# Altium schematic sheet Sensor_Sheet_2.SchDoc
size A4; DocumentNumber: 4; SheetNumber: 4; SheetTotal: 11
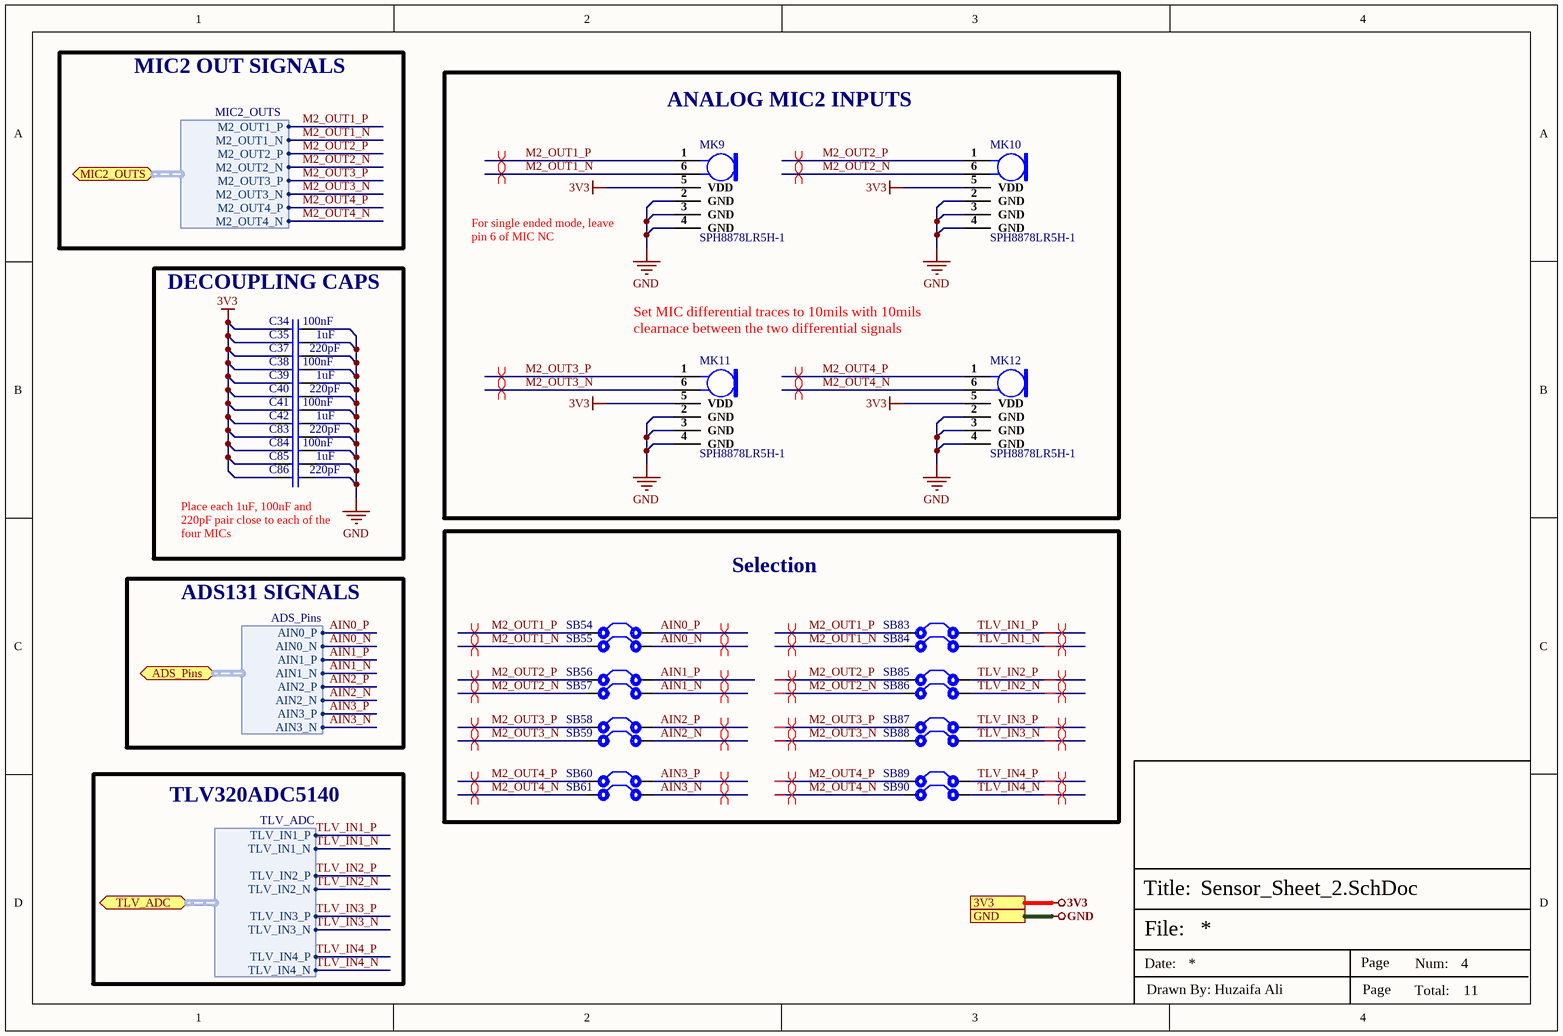
[diagram p0: Sensor_Sheet_2.SchDoc]

## Parts
C34  100nF  [Cap-0603]
C35  1uF  [Cap-0402]
C37  220pF  [Cap 0402]
C38  100nF  [Cap-0603]
C39  1uF  [Cap-0402]
C40  220pF  [Cap 0402]
C41  100nF  [Cap-0603]
C42  1uF  [Cap-0402]
C83  220pF  [Cap 0402]
C84  100nF  [Cap-0603]
C85  1uF  [Cap-0402]
C86  220pF  [Cap 0402]
MK9  SPH8878LR5H-1  [SPH8878LR5H-1]
MK10  SPH8878LR5H-1  [SPH8878LR5H-1]
MK11  SPH8878LR5H-1  [SPH8878LR5H-1]
MK12  SPH8878LR5H-1  [SPH8878LR5H-1]
SB54  Solder Bridge  [Solder Bridge]  (value not drawn)
SB55  Solder Bridge  [Solder Bridge]  (value not drawn)
SB56  Solder Bridge  [Solder Bridge]  (value not drawn)
SB57  Solder Bridge  [Solder Bridge]  (value not drawn)
SB58  Solder Bridge  [Solder Bridge]  (value not drawn)
SB59  Solder Bridge  [Solder Bridge]  (value not drawn)
SB60  Solder Bridge  [Solder Bridge]  (value not drawn)
SB61  Solder Bridge  [Solder Bridge]  (value not drawn)
SB83  Solder Bridge  [Solder Bridge]  (value not drawn)
SB84  Solder Bridge  [Solder Bridge]  (value not drawn)
SB85  Solder Bridge  [Solder Bridge]  (value not drawn)
SB86  Solder Bridge  [Solder Bridge]  (value not drawn)
SB87  Solder Bridge  [Solder Bridge]  (value not drawn)
SB88  Solder Bridge  [Solder Bridge]  (value not drawn)
SB89  Solder Bridge  [Solder Bridge]  (value not drawn)
SB90  Solder Bridge  [Solder Bridge]  (value not drawn)

## Blocks framed on the sheet
ANALOG MIC2 INPUTS: MK9-MK12
DECOUPLING CAPS: C34 C35 C37-C42 C83-C86
Selection: SB54-SB61 SB83-SB90

## Ports
3V3, ADS_Pins (bidir, harness ADS_Pins), GND, MIC2_OUTS (bidir, harness MIC2_OUTS), TLV_ADC (bidir, harness TLV_ADC)

## Harnesses
ADS_Pins: AIN2_P, AIN2_N, AIN3_N, AIN3_P, AIN0_P, AIN0_N, AIN1_N, AIN1_P
TLV_ADC: TLV_IN1_P, TLV_IN1_N, TLV_IN2_P, TLV_IN2_N, TLV_IN3_P, TLV_IN3_N, TLV_IN4_P, TLV_IN4_N
MIC2_OUTS: M2_OUT2_P, M2_OUT1_P, M2_OUT1_N, M2_OUT2_N, M2_OUT4_P, M2_OUT3_P, M2_OUT3_N, M2_OUT4_N

## Nets
3V3: C34.1 C35.1 C37.1 C38.1 C39.1 C40.1 C41.1 C42.1 C83.1 C84.1 C85.1 C86.1 MK9.5(VDD) MK10.5(VDD) MK11.5(VDD) MK12.5(VDD) ; port 3V3
GND: C34.2 C35.2 C37.2 C38.2 C39.2 C40.2 C41.2 C42.2 C83.2 C84.2 C85.2 C86.2 MK9.2(GND) MK9.3(GND) MK9.4(GND) MK10.2(GND) MK10.3(GND) MK10.4(GND) MK11.2(GND) MK11.3(GND) MK11.4(GND) MK12.2(GND) MK12.3(GND) MK12.4(GND) ; port GND
AIN0_N: SB55.2 ; port ADS_Pins.AIN0_N
AIN0_P: SB54.2 ; port ADS_Pins.AIN0_P
AIN1_N: SB57.2 ; port ADS_Pins.AIN1_N
AIN1_P: SB56.2 ; port ADS_Pins.AIN1_P
AIN2_N: SB59.2 ; port ADS_Pins.AIN2_N
AIN2_P: SB58.2 ; port ADS_Pins.AIN2_P
AIN3_N: SB61.2 ; port ADS_Pins.AIN3_N
AIN3_P: SB60.2 ; port ADS_Pins.AIN3_P
M2_OUT1_N: MK9.6(OUT-) SB55.1 SB84.1 ; port MIC2_OUTS.M2_OUT1_N
M2_OUT1_P: MK9.1(OUT+) SB54.1 SB83.1 ; port MIC2_OUTS.M2_OUT1_P
M2_OUT2_N: MK10.6(OUT-) SB57.1 SB86.1 ; port MIC2_OUTS.M2_OUT2_N
M2_OUT2_P: MK10.1(OUT+) SB56.1 SB85.1 ; port MIC2_OUTS.M2_OUT2_P
M2_OUT3_N: MK11.6(OUT-) SB59.1 SB88.1 ; port MIC2_OUTS.M2_OUT3_N
M2_OUT3_P: MK11.1(OUT+) SB58.1 SB87.1 ; port MIC2_OUTS.M2_OUT3_P
M2_OUT4_N: MK12.6(OUT-) SB61.1 SB90.1 ; port MIC2_OUTS.M2_OUT4_N
M2_OUT4_P: MK12.1(OUT+) SB60.1 SB89.1 ; port MIC2_OUTS.M2_OUT4_P
TLV_IN1_N: SB84.2 ; port TLV_ADC.TLV_IN1_N
TLV_IN1_P: SB83.2 ; port TLV_ADC.TLV_IN1_P
TLV_IN2_N: SB86.2 ; port TLV_ADC.TLV_IN2_N
TLV_IN2_P: SB85.2 ; port TLV_ADC.TLV_IN2_P
TLV_IN3_N: SB88.2 ; port TLV_ADC.TLV_IN3_N
TLV_IN3_P: SB87.2 ; port TLV_ADC.TLV_IN3_P
TLV_IN4_N: SB90.2 ; port TLV_ADC.TLV_IN4_N
TLV_IN4_P: SB89.2 ; port TLV_ADC.TLV_IN4_P

## Layout directives
differential pair; net class OUT1; differential pair class OUT1_Lines: M2_OUT1_N, M2_OUT1_P, M2_OUT2_N, M2_OUT2_P, M2_OUT3_N, M2_OUT3_P, M2_OUT4_N, M2_OUT4_P
differential pair; net class AIN0; differential pair class AIN0_Lines: AIN0_N, AIN0_P
differential pair; net class AIN1; differential pair class AIN1_Lines: AIN1_N, AIN1_P
differential pair; net class AIN2; differential pair class AIN2_Lines: AIN2_N, AIN2_P
differential pair; net class AIN3; differential pair class AIN3_Lines: AIN3_N, AIN3_P
differential pair; net class M2_OUT1; differential pair class M2_OUT1_Lines: M2_OUT1_N, M2_OUT1_P
differential pair; net class M2_OUT2; differential pair class M2_OUT2_Lines: M2_OUT2_N, M2_OUT2_P
differential pair; net class M2_OUT3; differential pair class M2_OUT3_Lines: M2_OUT3_N, M2_OUT3_P
differential pair; net class M2_OUT4; differential pair class M2_OUT4_Lines: M2_OUT4_N, M2_OUT4_P
differential pair; net class TLV_IN1; differential pair class TLV_IN1_Lines: TLV_IN1_N, TLV_IN1_P
differential pair; net class TLV_IN2; differential pair class TLV_IN2_Lines: TLV_IN2_N, TLV_IN2_P
differential pair; net class TLV_IN3; differential pair class TLV_IN3_Lines: TLV_IN3_N, TLV_IN3_P
differential pair; net class TLV_IN4; differential pair class TLV_IN4_Lines: TLV_IN4_N, TLV_IN4_P

## Notes on the sheet
- MIC2 OUT SIGNALS
- For single ended mode, leave pin 6 of MIC NC
- (near MK11) Set MIC differential traces to 10mils with 10mils clearnace between the two differential signals
- Place each 1uF, 100nF and 220pF pair close to each of the four MICs
- ADS131 SIGNALS
- TLV320ADC5140
- File:
- Title:
- Date:
- Page
- Num:
- Total:
- Drawn By: Huzaifa Ali

## Library data of the parts
C34 C38 C41 C84 = CC0603KRX5R9BB104: CAP CER 0.1UF 50V X5R 0603; Manufacturer: Yageo; Tolerance: 10%; Item Type: Capacitor; Supplier 1: Digi-Key; Manufacturer Part Number: CC0603KRX5R9BB104; RoHS: Yes; Category: Ceramic Capacitors; Stock 1: 152253; Pricing 1: 1=0.10000, 10=0.05200, 50=0.02820, 100=0.02310, 500=0.01648, 1000=0.01294 (USD); Mount: Surface Mount; Case/Package: 0603; Case Code (Imperial): 0603; Case Code (Metric): 1608; Weight: 7.1E-05oz; Min Operating Temperature: -55°C; Max Operating Temperature: 85°C; Capacitance: 100nF; Packaging: Tape and Reel; Voltage Rating: 50V; Dielectric: X5R; Termination: SMD/SMT; Voltage Rating (DC): 50V; Package Quantity: 4000; Length: 0.063inch; Width: 0.031inch; Thickness: 0.035inch; Lead Free: Lead Free; Halogen Free: Halogen Free; ComponentLink1URL: http://www.mouser.com/ds/2/447/Yageo_UPY-GP_NP0_16V-to-50V_9-358835.pdf?src-supplier=Mouser; ComponentLink1Description: http://www.mouser.com/ds/2/447/Yageo_UPY-GP_NP0_16V-to-50V_9-358835.pdf?src-supplier=Mouser; ComponentLink2URL: https://www.yageo.com/upload/media/product/productsearch/datasheet/mlcc/UPY-GPHC_X5R_4V-to-50V_26.pdf?src-supplier=Digi-Key; ComponentLink2Description: https://www.yageo.com/upload/media/product/productsearch/datasheet/mlcc/UPY-GPHC_X5R_4V-to-50V_26.pdf?src-supplier=Digi-Key; ComponentLink3URL: http://www.yageo.com/exep/pages/download/literatures/ProductSelectionGuide%202014_Final_2.pdf?src-supplier=Digi-Key; ComponentLink3Description: http://www.yageo.com/exep/pages/download/literatures/ProductSelectionGuide%202014_Final_2.pdf?src-supplier=Digi-Key; Supplier Part Number 1: 311-4046-1-ND; LCSC Part Number: C110022
C35 C39 C42 C85 = CC0402KRX5R8BB105: CAP CER 1UF 25V X5R 0402; Manufacturer: Yageo; Tolerance: 10%; Supplier 1: Mouser; Manufacturer Part Number: CC0402KRX5R8BB105; RoHS: Yes; Category: Ceramic Capacitors; Stock 1: 91975; Pricing 1: 1=0.30000, 10=0.20400, 50=0.20400, 100=0.11600, 1000=0.07200, 10000=0.05900 (USD); Mount: Surface Mount; Case/Package: 0402; Case Code (Metric): 1005; Case Code (Imperial): 0402; Weight: 2.3E-05oz; Min Operating Temperature: -55°C; Max Operating Temperature: 85°C; Packaging: Tape and Reel; Capacitance: 1uF; Voltage Rating: 25V; Dielectric: X5R; Termination: SMD/SMT; Voltage Rating (DC): 25V; Package Quantity: 10000; Length: 0.039inch; Width: 0.02inch; Thickness: 0.022inch; Lead Free: Lead Free; Halogen Free: Halogen Free; RoHS Compliant: Yes; ComponentLink1URL: http://www.mouser.com/ds/2/447/Yageo_UPY-GP_NP0_16V-to-50V_9-358835.pdf?src-supplier=Mouser; ComponentLink1Description: http://www.mouser.com/ds/2/447/Yageo_UPY-GP_NP0_16V-to-50V_9-358835.pdf?src-supplier=Mouser; ComponentLink2URL: http://www.yageo.com/documents/recent/UPY-GPHC_X5R_4V-to-50V_25.pdf?src-supplier=Digi-Key; ComponentLink2Description: http://www.yageo.com/documents/recent/UPY-GPHC_X5R_4V-to-50V_25.pdf?src-supplier=Digi-Key; ComponentLink3URL: https://4donline.ihs.com/images/VipMasterIC/IC/YAGO/YAGO-S-A0006851646/YAGO-S-A0006851646-1.pdf?hkey=6D3A4C79FDBF58556ACFDE234799DDF0&src-supplier=Newark; ComponentLink3Description: https://4donline.ihs.com/images/VipMasterIC/IC/YAGO/YAGO-S-A0006851646/YAGO-S-A0006851646-1.pdf?hkey=6D3A4C79FDBF58556ACFDE234799DDF0&src-supplier=Newark; Supplier Part Number 1: 603-CC402KRX5R8BB105; LCSC Part Number: C326568
C37 C40 C83 C86 = CC0402JRNPO9BN221: CAP CER 220PF 50V C0G/NPO 0402; Manufacturer: Yageo; Dielectric Material: Ceramic; Tolerance: 10%; Dielectric: C0G; Temperature Coefficient: 30ppm/°C; Insulation Resistance: 10GR; Dissipation Factor: 0.1%; Supplier 1: RSComponents; Manufacturer Part Number: CC0402JRNPO9BN221; RoHS: Yes; Category: Ceramic Capacitors; Stock 1: 20000; Pricing 1: 10000=0.00600, 100000=0.00600 (GBP); Mount: Surface Mount; Case/Package: 0402; Number of Pins: 2; Case Code (Metric): 1005; Case Code (Imperial): 0402; Min Operating Temperature: -55°C; Max Operating Temperature: 125°C; Capacitance: 220pF; Package Quantity: 1; Voltage Rating: 50V; Packaging: Tape and Reel; Termination: SMD/SMT; Voltage: 50V; Series: CC; Length: 1mm; Width: 0.02inch; Height: 0.5mm; Thickness: 0.022inch; Depth: 0.5mm; Radiation Hardening: No; RoHS Compliant: Yes; REACH SVHC: No SVHC; Lead Free: Lead Free; ComponentLink1URL: https://datasheet.ciiva.com/11786/0900766b8079c870-11786154.pdf?src-supplier=RSComponents; ComponentLink1Description: https://datasheet.ciiva.com/11786/0900766b8079c870-11786154.pdf?src-supplier=RSComponents; ComponentLink2URL: https://datasheet.ciiva.com/7656/1132289-7656616.pdf?src-supplier=Element14; ComponentLink2Description: https://datasheet.ciiva.com/7656/1132289-7656616.pdf?src-supplier=Element14; ComponentLink3URL: https://datasheet.ciiva.com/8033/1443161-8033609.pdf?src-supplier=Element14; ComponentLink3Description: https://datasheet.ciiva.com/8033/1443161-8033609.pdf?src-supplier=Element14; ComponentLink4URL: https://datasheet.ciiva.com/8033/1443161-8033608.pdf?src-supplier=Element14; ComponentLink4Description: https://datasheet.ciiva.com/8033/1443161-8033608.pdf?src-supplier=Element14; ComponentLink5URL: https://datasheet.ciiva.com/176/mlccorderingcode-176384.pdf?src-supplier=Digi-Key; ComponentLink5Description: https://datasheet.ciiva.com/176/mlccorderingcode-176384.pdf?src-supplier=Digi-Key; ComponentLink6URL: https://datasheet.ciiva.com/176/mlccorderingcode-176383.pdf?src-supplier=Digi-Key; ComponentLink6Description: https://datasheet.ciiva.com/176/mlccorderingcode-176383.pdf?src-supplier=Digi-Key; ComponentLink7URL: https://datasheet.ciiva.com/176/mlccorderingcode-176385.pdf?src-supplier=Digi-Key; ComponentLink7Description: https://datasheet.ciiva.com/176/mlccorderingcode-176385.pdf?src-supplier=Digi-Key; ComponentLink8URL: https://datasheet.ciiva.com/17434/upy-gp-np0-16v-to-50v-8-17434343.pdf?src-supplier=Avnet+Europe; ComponentLink8Description: https://datasheet.ciiva.com/17434/upy-gp-np0-16v-to-50v-8-17434343.pdf?src-supplier=Avnet+Europe; Supplier Part Number 1: 6169284
MK9-MK12 = SPH8878LR5H-1: Lovato Analog Bottom Port Mic; Manufacturer: Knowles; Item Type: Microphone; Supplier 1: Digi-Key; Manufacturer Part Number: SPH8878LR5H-1; RoHS: No; Category: Microphones; Stock 1: 1676; Pricing 1: 1=1.45000, 10=1.20800, 25=1.11760, 50=1.05220, 100=0.98880, 500=0.85076, 1000=0.79529 (USD); Supplier Part Number 1: 423-SPH8878LR5H-1CT-ND; LCSC Part Number: *
SB54-SB61 SB83-SB90 = Solder Bridge: Solder Bridge ON